# Altium schematic sheet mach_kiem_tra_nguon.SchDoc
size A1
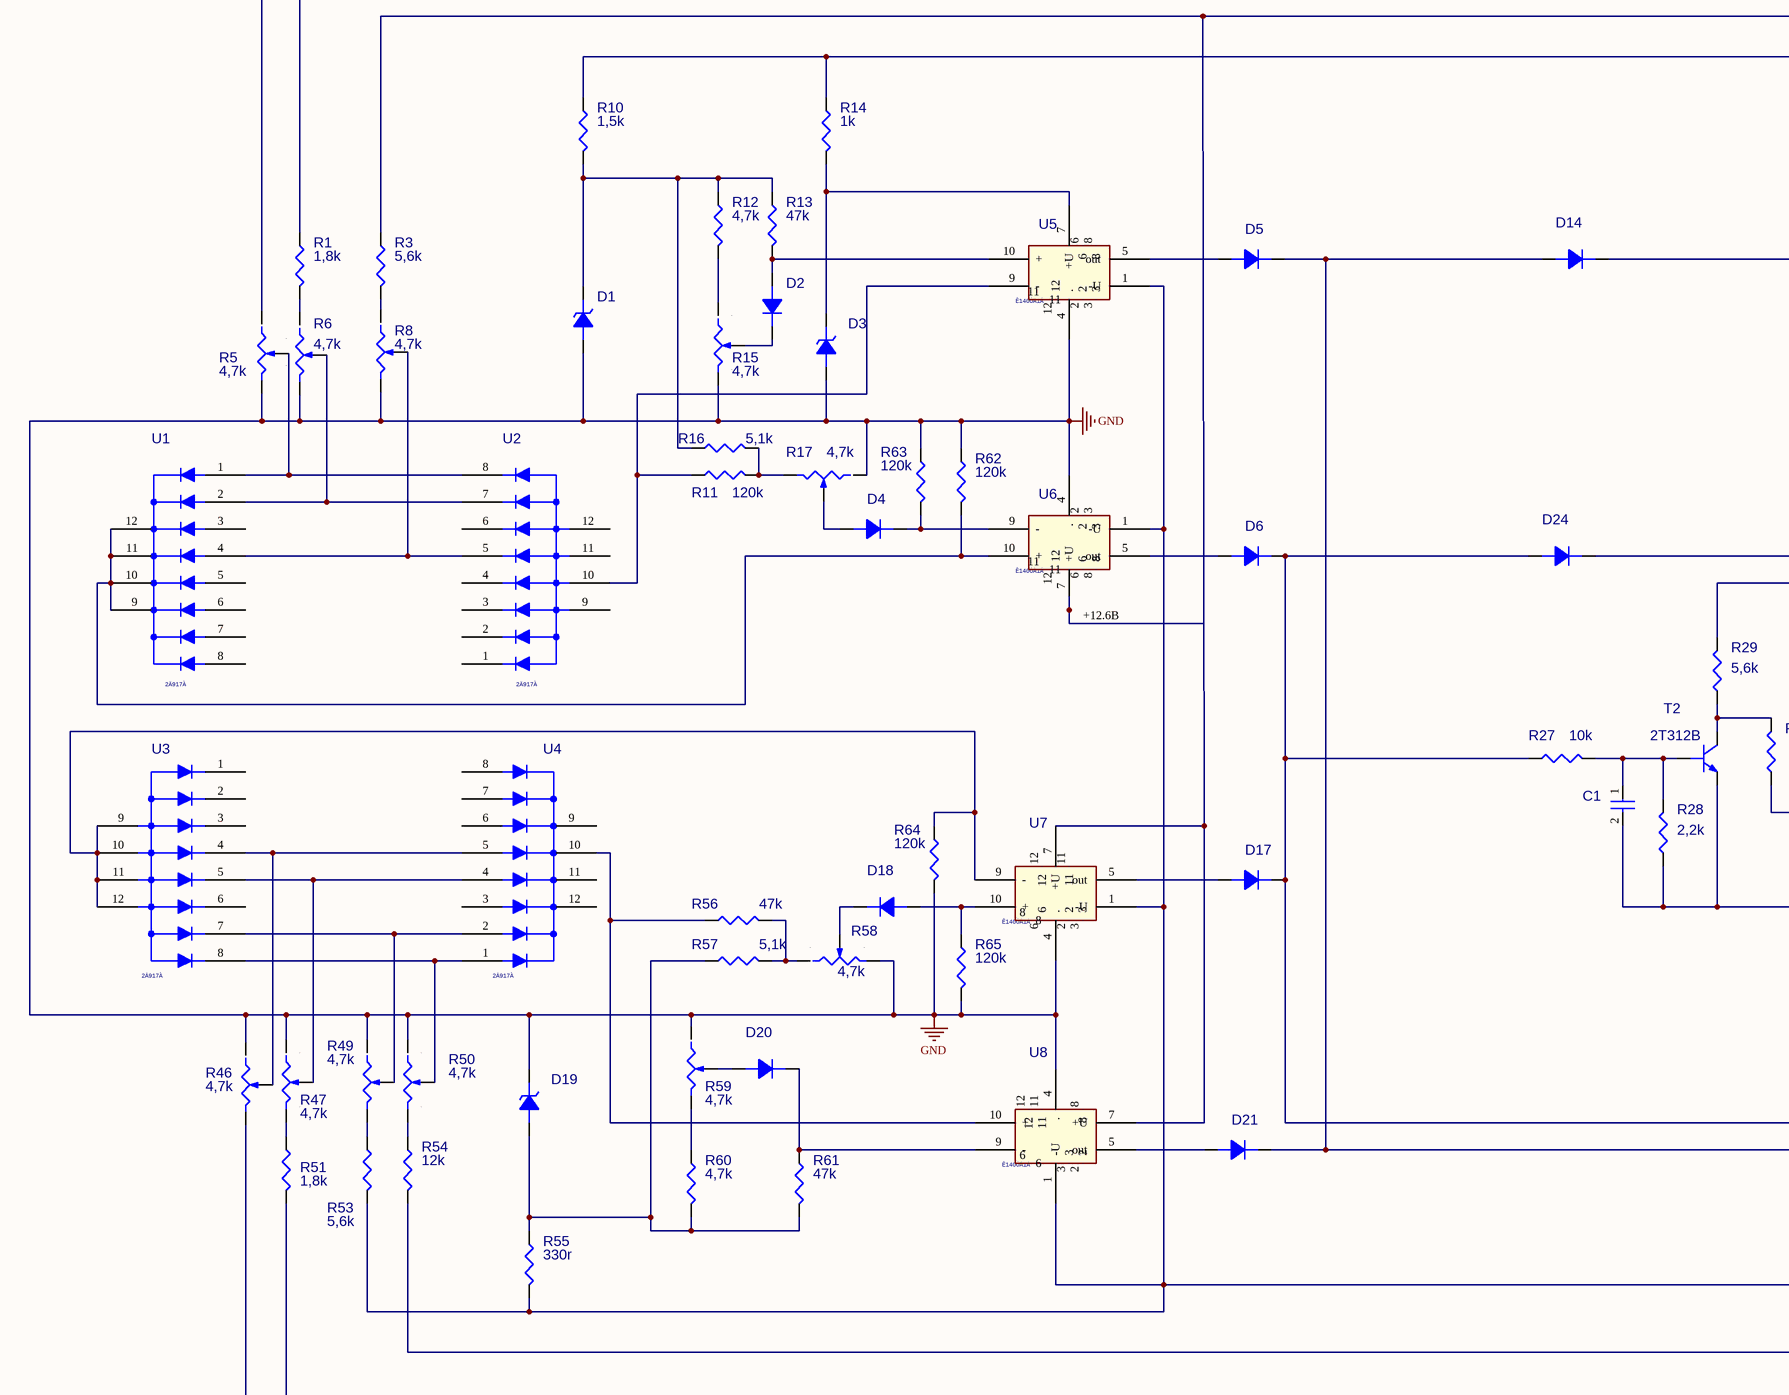
[diagram p0: mach_kiem_tra_nguon.SchDoc, left]
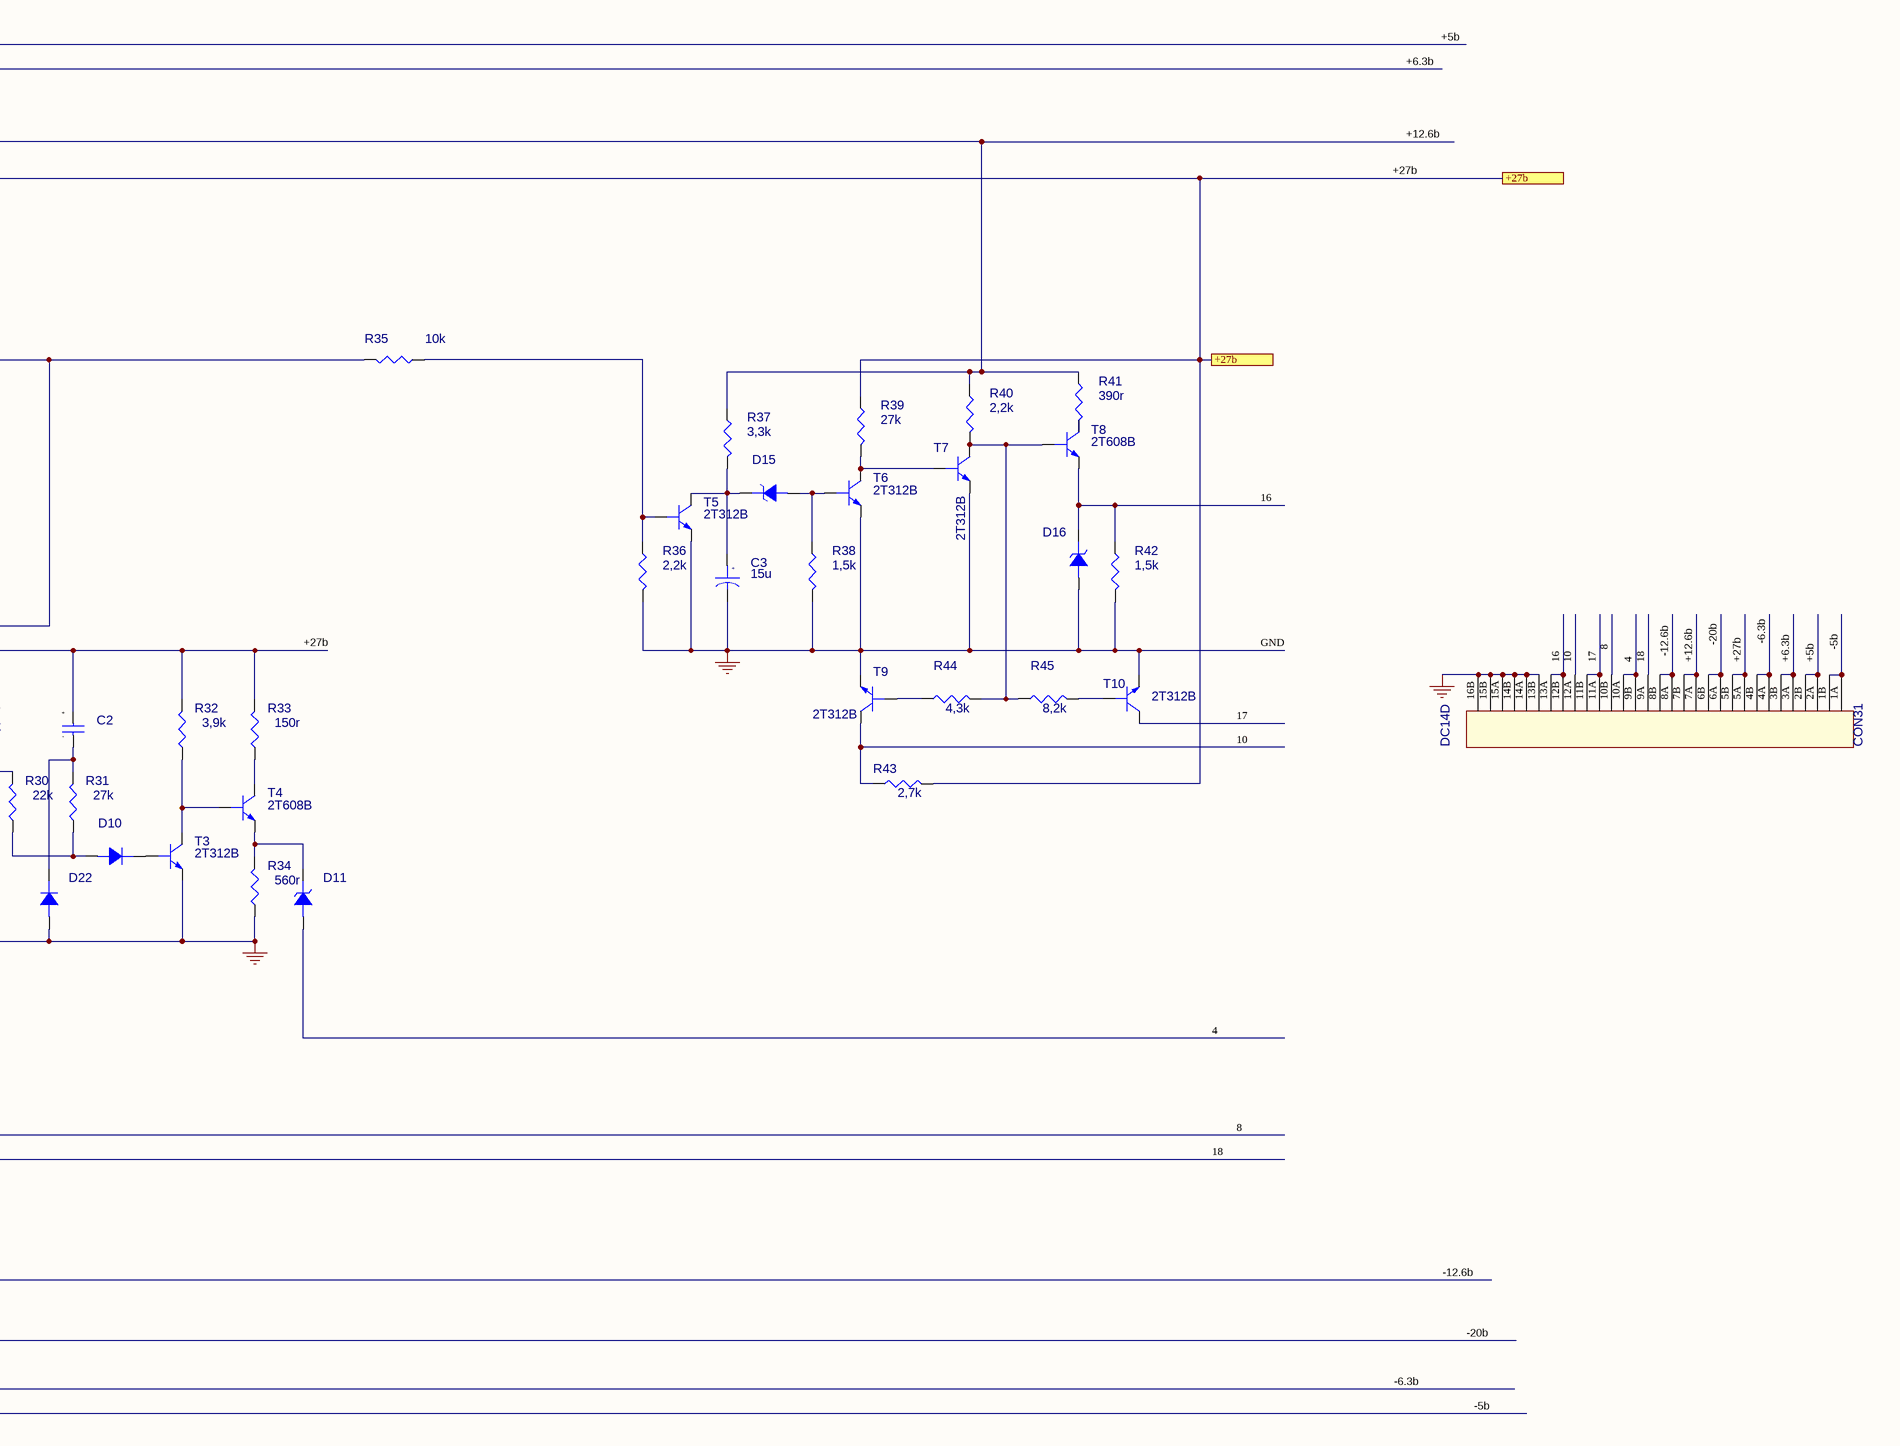
[diagram p1: mach_kiem_tra_nguon.SchDoc, right]

## Parts
C1  ceramic  [cap_km_5b]  (value not drawn)
C2  3,3u  [capK52_1]  (value not drawn)
C3  15u  [capK53_1A]
D1  D818D  [diode_d818]  (value not drawn)
D2  2D510A  [diode640_2d510]  (value not drawn)
D3  DIODE ZENER  [diode_d818]  (value not drawn)
D4  2D510A  [diode640_2d510]  (value not drawn)
D5  2D103A  [diode_2d103a]  (value not drawn)
D6  2D103A  [diode_2d103a]  (value not drawn)
D10  2D103A  [diode_2d103a]  (value not drawn)
D11  2456A  [diode_d818]  (value not drawn)
D14  2D103A  [diode_2d103a]  (value not drawn)
D15  D818D  [diode_d818]  (value not drawn)
D16  2456A  [diode_d818]  (value not drawn)
D17  2D103A  [diode_2d103a]  (value not drawn)
D18  2D510A  [diode640_2d510]  (value not drawn)
D19  D818D  [diode_d818]  (value not drawn)
D20  2D510A  [diode640_2d510]  (value not drawn)
D21  2D103A  [diode_2d103a]  (value not drawn)
D22  2D510A  [diode640_2d510]  (value not drawn)
D24  2D103A  [diode_2d103a]  (value not drawn)
DC14D  CON31  [DC14B]
R1  1,8k  [res0805]
R3  5,6k  [res0805]
R5  4,7k  [res_var_cp5_3_4]
R6  4,7k  [res_var_cp5_3_3]
R8  4,7k  [res_var_cp5_3_4]
R10  1,5k  [res_1w]
R11  120k  [res0805]
R12  4,7k  [res0805]
R13  47k  [res0805]
R14  1k  [res_1w]
R15  4,7k  [res_var_cp5_3_3]
R16  5,1k  [res0805]
R17  4,7k  [res_var_cp5_3_4]
R27  10k  [res0805]
R28  2,2k  [res0805]
R29  5,6k  [res0805]
R30  22k  [res0805]
R31  27k  [res0805]
R32  3,9k  [res_05w]
R33  150r  [res0805]
R34  560r  [res0805]
R35  10k  [res0805]
R36  2,2k  [res0805]
R37  3,3k  [res0805]
R38  1,5k  [res0805]
R39  27k  [res0805]
R40  2,2k  [res0805]
R41  390r  [res_05w]
R42  1,5k  [res0805]
R43  2,7k  [res_1w]
R44  4,3k  [res0805]
R45  8,2k  [res0805]
R46  4,7k  [res_var_cp5_3_4]
R47  4,7k  [res_var_cp5_3_3]
R49  4,7k  [res_var_cp5_3_4]
R50  4,7k  [res_var_cp5_3_3]
R51  1,8k  [res0805]
R53  5,6k  [res0805]
R54  12k  [res0805]
R55  330r  [res0805]
R56  47k  [res0805]
R57  5,1k  [res0805]
R58  4,7k  [res_var_cp5_3_3]
R59  4,7k  [res_var_cp5_3_4]
R60  4,7k  [res0805]
R61  47k  [res0805]
R62  120k  [res0805]
R63  120k  [res0805]
R64  120k  [res0805]
R65  120k  [res0805]
T2  2T312B  [to_2t312b_bec]
T3  2T312B  [to_2t312b_bec]
T4  2T608B  [to_2t608b_bce]
T5  2T312B  [to_2t312b_bec]
T6  2T312B  [to_2t312b_bec]
T7  2T312B  [to_2t312b_bec]
T8  2T608B  [to_2t608b_bce]
T9  2T312B  [to_2t312b_bec]
T10  2T312B  [to_2t312b_bec]
U1  2D908A  [2d908_917a]  (value not drawn)
U2  2D917A  [2d908_917a]  (value not drawn)
U3  2D917A  [2d908_917a]  (value not drawn)
U4  2D908A  [2d908_917a]  (value not drawn)
U5  to12_pin  [k140ud1_1]  (value not drawn)
U6  to12_pin  [k140ud1_1]  (value not drawn)
U7  to12_pin  [k140ud1_1]  (value not drawn)
U8  to12_pin  [k140ud1_1]  (value not drawn)

## Ports
+27b

## Nets
GND: C1.2 C3.2 D1.1(ANODE) D3.1(ANODE) D16.1(ANODE) D19.2(CATHODE) D22.1(A) DC14D.13B DC14D.14A DC14D.14B DC14D.15A DC14D.15B DC14D.16B R5.3(B) R6.3(B) R8.3(B) R15.3(B) R17.1(A) R28.1 R34.1 R36.2 R38.2 R42.2 R46.1(A) R47.1(A) R49.1(A) R50.1(A) R58.3(B) R59.1(A) R62.1 R63.1 R64.2 R65.2 T2.2(E) T3.2(E) T5.2(E) T6.2(E) T7.2(E) T9.2(E) T10.2(E) U5.4(.) U6.4(.) U7.4(.) U8.4(.)
4: D11.1(ANODE) DC14D.9B DC14D.10A
8: D6.2(K) D17.2(K) D24.1(A) DC14D.10B R27.1
10: DC14D.12A R43.1 T9.3(C)
16: D16.2(CATHODE) DC14D.12B DC14D.13A R42.1 T8.2(E)
17: DC14D.11A DC14D.11B T10.3(C)
18: D5.2(K) D14.1(A) D21.2(K) DC14D.9A
+5b: DC14D.2A DC14D.2B R5.1(A)
+6.3b: DC14D.3A DC14D.3B R1.1
+12.6b: DC14D.7A DC14D.7B R3.1 R37.1 R40.1 R41.1 U6.7(+U) U7.7(+U) U8.7(+U)
+27b: C2.1 DC14D.5A DC14D.5B R10.1 R14.1 R29.2 R32.2 R33.2 R39.1 R43.2 ; port +27b
-5b: DC14D.1A DC14D.1B R46.3(B)
-6.3b: DC14D.4A DC14D.4B R51.2
-12.6b: DC14D.8A DC14D.8B R53.2 R55.2 U5.1(-U) U6.1(-U) U7.1(-U) U8.1(-U)
-20b: DC14D.6A DC14D.6B R54.2
NetC1_1: C1.1 R27.2 R28.2 T2.1(B)
NetC2_2: C2.2 D22.2(K) R31.2
NetC3_1: C3.1 D15.2(CATHODE) R37.2 T5.3(C)
NetD1_2: D1.2(CATHODE) R10.2 R12.1 R13.1 R16.1
NetD2_1: D2.1(A) R13.2 U5.10(+)
NetD2_2: D2.2(K) R15.2(WIPER)
NetD3_2: D3.2(CATHODE) R14.2 U5.7(+U)
NetD4_1: D4.1(A) R17.2(WIPER)
NetD4_2: D4.2(K) R63.2 U6.9(-)
NetD5_1: D5.1(A) U5.5(out)
NetD6_1: D6.1(A) U6.5(out)
NetD10_1: D10.1(A) R30.1 R31.1
NetD10_2: D10.2(K) T3.1(B)
NetD11_2: D11.2(CATHODE) R34.2 T4.2(E)
NetD14_2: D14.2(K) D24.2(K) R35.2
NetD15_1: D15.1(ANODE) R38.1 T6.1(B)
NetD17_1: D17.1(A) U7.5(out)
NetD18_1: D18.1(A) R65.1 U7.10(+)
NetD18_2: D18.2(K) R58.2(WIPER)
NetD19_1: D19.1(ANODE) R55.1 R57.1 R60.2 R61.2
NetD20_1: D20.1(A) R59.2(WIPER)
NetD20_2: D20.2(K) R61.1 U8.9(-)
NetD21_1: D21.1(A) U8.5(out)
NetR1_2: R1.2 R6.1(A)
NetR3_2: R3.2 R8.1(A)
NetR5_2: R5.2(WIPER) U1.1(DP2) U2.8(DP2)
NetR6_2: R6.2(WIPER) U1.2(G) U2.7(G)
NetR8_2: R8.2(WIPER) U1.4(E) U2.5(E)
NetR11_1: R11.1 U2.10(CA2) U5.9(-)
NetR11_2: R11.2 R16.2 R17.3(B)
NetR12_2: R12.2 R15.1(A)
NetR29_1: R29.1 R30.2 T2.3(C)
NetR32_1: R32.1 T3.3(C) T4.1(B)
NetR33_1: R33.1 T4.3(C)
NetR35_1: R35.1 R36.1 T5.1(B)
NetR39_2: R39.2 T6.3(C) T7.1(B)
NetR40_2: R40.2 R44.2 R45.1 T7.3(C) T8.1(B)
NetR41_2: R41.2 T8.3(C)
NetR44_1: R44.1 T9.1(B)
NetR45_2: R45.2 T10.1(B)
NetR46_2: R46.2(WIPER) U3.4(D) U4.5(D)
NetR47_2: R47.2(WIPER) U3.5(E) U4.4(E)
NetR47_3: R47.3(B) R51.1
NetR49_2: R49.2(WIPER) U3.7(G) U4.2(G)
NetR49_3: R49.3(B) R53.1
NetR50_2: R50.2(WIPER) U3.8(DP2) U4.1(DP2)
NetR50_3: R50.3(B) R54.1
NetR56_1: R56.1 U4.10(CA2) U8.10(+)
NetR56_2: R56.2 R57.2 R58.1(A)
NetR59_3: R59.3(B) R60.1
NetR62_2: R62.2 U1.9(CA1) U1.10(CA2) U1.11(CA3) U1.12(CA4) U6.10(+)
NetR64_1: R64.1 U3.9(CA1) U3.10(CA2) U3.11(CA3) U3.12(CA4) U7.9(-)

Not connected (* = marked no-connect by the designer): R6 4 5; R15 4 5; R47 4 5; R50 4 5; R58 4 5; U1 3(F) 5(D) 6(C) 7(B) 8(A); U2 1(A) 2(B) 3(C) 4(D) 6(F) 9(CA1) 11(CA3) 12(CA4); U3 1(A) 2(B) 3(C) 6(F); U4 3(F) 6(C) 7(B) 8(A) 9(CA1) 11(CA3) 12(CA4); U5 2 3 6 8 11 12; U6 2 3 6 8 11 12; U7 2 3 6 8 11 12; U8 2 3 6 8 11 12

## Notes on the sheet
- (near C2) +
- (near C2) -
- (in symbol CAP POL) +
- (in symbol K140UD1B_8) Ê140ÓÄ1Á
- (in symbol K140UD1B_9) Ê140ÓÄ1Á
- (in symbol K140UD1B_10) Ê140ÓÄ1Á
- (in symbol K140UD1B_13) Ê140ÓÄ1Á
- (in symbol LDS-A81R_20) 2Ä917À
- (in symbol LDS-A81R_21) 2Ä917À
- (in symbol LDS-A81R_22) 2Ä917À
- (in symbol LDS-A81R_25) 2Ä917À

## Library data of the parts
C1 = CAP NP
C2 = CAP NP_Dup1
C3 = CAP POL
D1 D11 D15 D16 D19 = DIODE ZENER
D2 D4-D6 D10 D14 D17 D18 D20-D22 D24 = DIODE
R1 R3 R10-R14 R16 R27-R45 R51 R53-R57 R60-R65 = RESISTOR_0
R5 = RESISTOR VAR_3
R6 = RESISTOR VAR_4
R8 = RESISTOR VAR_5
R15 R47 R50 R58 = RESISTOR VAR_1
R17 = RESISTOR VAR_6
R46 = RESISTOR VAR_10
R49 = RESISTOR VAR_7
R59 = RESISTOR VAR_8
T2-T10 = NPN ECB_0
U1 = LDS-A81R_20
U2 = LDS-A81R_25
U3 = LDS-A81R_22
U4 = LDS-A81R_21
U5 = K140UD1B_10
U6 = K140UD1B_9
U7 = K140UD1B_8
U8 = K140UD1B_13